# Altium schematic sheet ESD-0.8V.SchDoc
size A; SheetNumber: 8; SheetTotal: 8
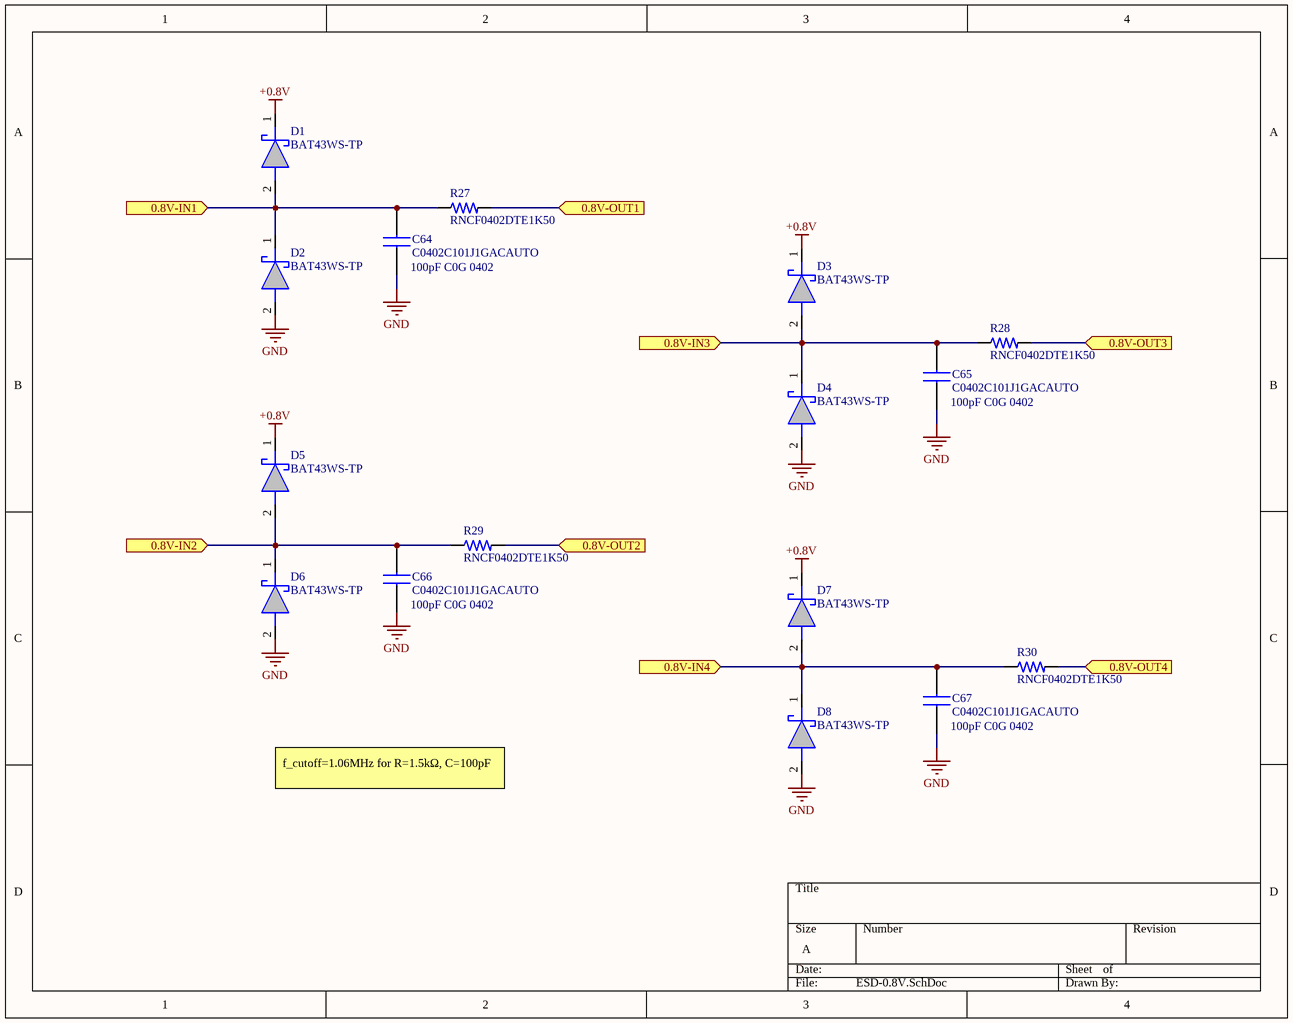
[diagram p0: ESD-0.8V.SchDoc]

## Parts
C64  C0402C101J1GACAUTO  [CAPC1005X55N]
C65  C0402C101J1GACAUTO  [CAPC1005X55N]
C66  C0402C101J1GACAUTO  [CAPC1005X55N]
C67  C0402C101J1GACAUTO  [CAPC1005X55N]
D1  BAT43WS-TP  [SOD2512X115N]
D2  BAT43WS-TP  [SOD2512X115N]
D3  BAT43WS-TP  [SOD2512X115N]
D4  BAT43WS-TP  [SOD2512X115N]
D5  BAT43WS-TP  [SOD2512X115N]
D6  BAT43WS-TP  [SOD2512X115N]
D7  BAT43WS-TP  [SOD2512X115N]
D8  BAT43WS-TP  [SOD2512X115N]
R27  RNCF0402DTE1K50  [RESC1005X35N]
R28  RNCF0402DTE1K50  [RESC1005X35N]
R29  RNCF0402DTE1K50  [RESC1005X35N]
R30  RNCF0402DTE1K50  [RESC1005X35N]

## Ports
0.8V-IN1 (in), 0.8V-IN2 (in), 0.8V-IN3 (in), 0.8V-IN4 (in), 0.8V-OUT1 (in), 0.8V-OUT2 (in), 0.8V-OUT3 (in), 0.8V-OUT4 (in)

## Nets
+0.8V: D1.1(K) D3.1(K) D5.1(K) D7.1(K)
GND: C64.1 C65.1 C66.1 C67.1 D2.2(A) D4.2(A) D6.2(A) D8.2(A)
0.8V-IN1: C64.2 D1.2(A) D2.1(K) R27.1 ; port 0.8V-IN1
0.8V-IN2: C66.2 D5.2(A) D6.1(K) R29.1 ; port 0.8V-IN2
0.8V-IN3: C65.2 D3.2(A) D4.1(K) R28.1 ; port 0.8V-IN3
0.8V-IN4: C67.2 D7.2(A) D8.1(K) R30.1 ; port 0.8V-IN4
0.8V-OUT1: R27.2 ; port 0.8V-OUT1
0.8V-OUT2: R29.2 ; port 0.8V-OUT2
0.8V-OUT3: R28.2 ; port 0.8V-OUT3
0.8V-OUT4: R30.2 ; port 0.8V-OUT4

## Notes on the sheet
- (near C64) 100pF C0G 0402
- (near C65) 100pF C0G 0402
- (near C66) 100pF C0G 0402
- (near C67) 100pF C0G 0402
- f_cutoff=1.06MHz for R=1.5kΩ, C=100pF

## Library data of the parts
C64-C67 = C0402C101J1GACAUTO: 100 pF ±5% 100V Ceramic Capacitor C0G, NP0 0402 (1005 Metric); MF: {'manufacturer': u'KEMET'}; Package: None; Price: None; Value: *; MP: C0402C101J1GACAUTO; Availability: Unavailable
D1-D8 = BAT43WS-TP: Small Signal Schottky Diodes; Manufacturer_Name: MCC; Geometry.Height: 1.15mm; Mouser Part Number: 833-BAT43WS-TP; Mouser Price/Stock: https://www.mouser.co.uk/ProductDetail/Micro-Commercial-Components-MCC/BAT43WS-TP?qs=Vo7e0yZOYdELUvvmcALzzg%3D%3D; Manufacturer_Part_Number: BAT43WS-TP; Datasheet Link: https://www.mccsemi.com/pdf/Products/BAT42WS-BAT43WS(SOD-323).pdf
R27-R30 = RNCF0402DTE1K50: 1.5 kOhms ±0.5% 0.1W, 1/10W Chip Resistor 0402 (1005 Metric) Automotive AEC-Q200 Thin Film; Package: None; Price: None; Value: *; MP: RNCF0402DTE1K50; Availability: Unavailable